# Altium schematic sheet 02_PWR_PMIC_RK806-1.SchDoc
size 594 x 420 mm; SheetNumber: 2; SheetTotal: 6
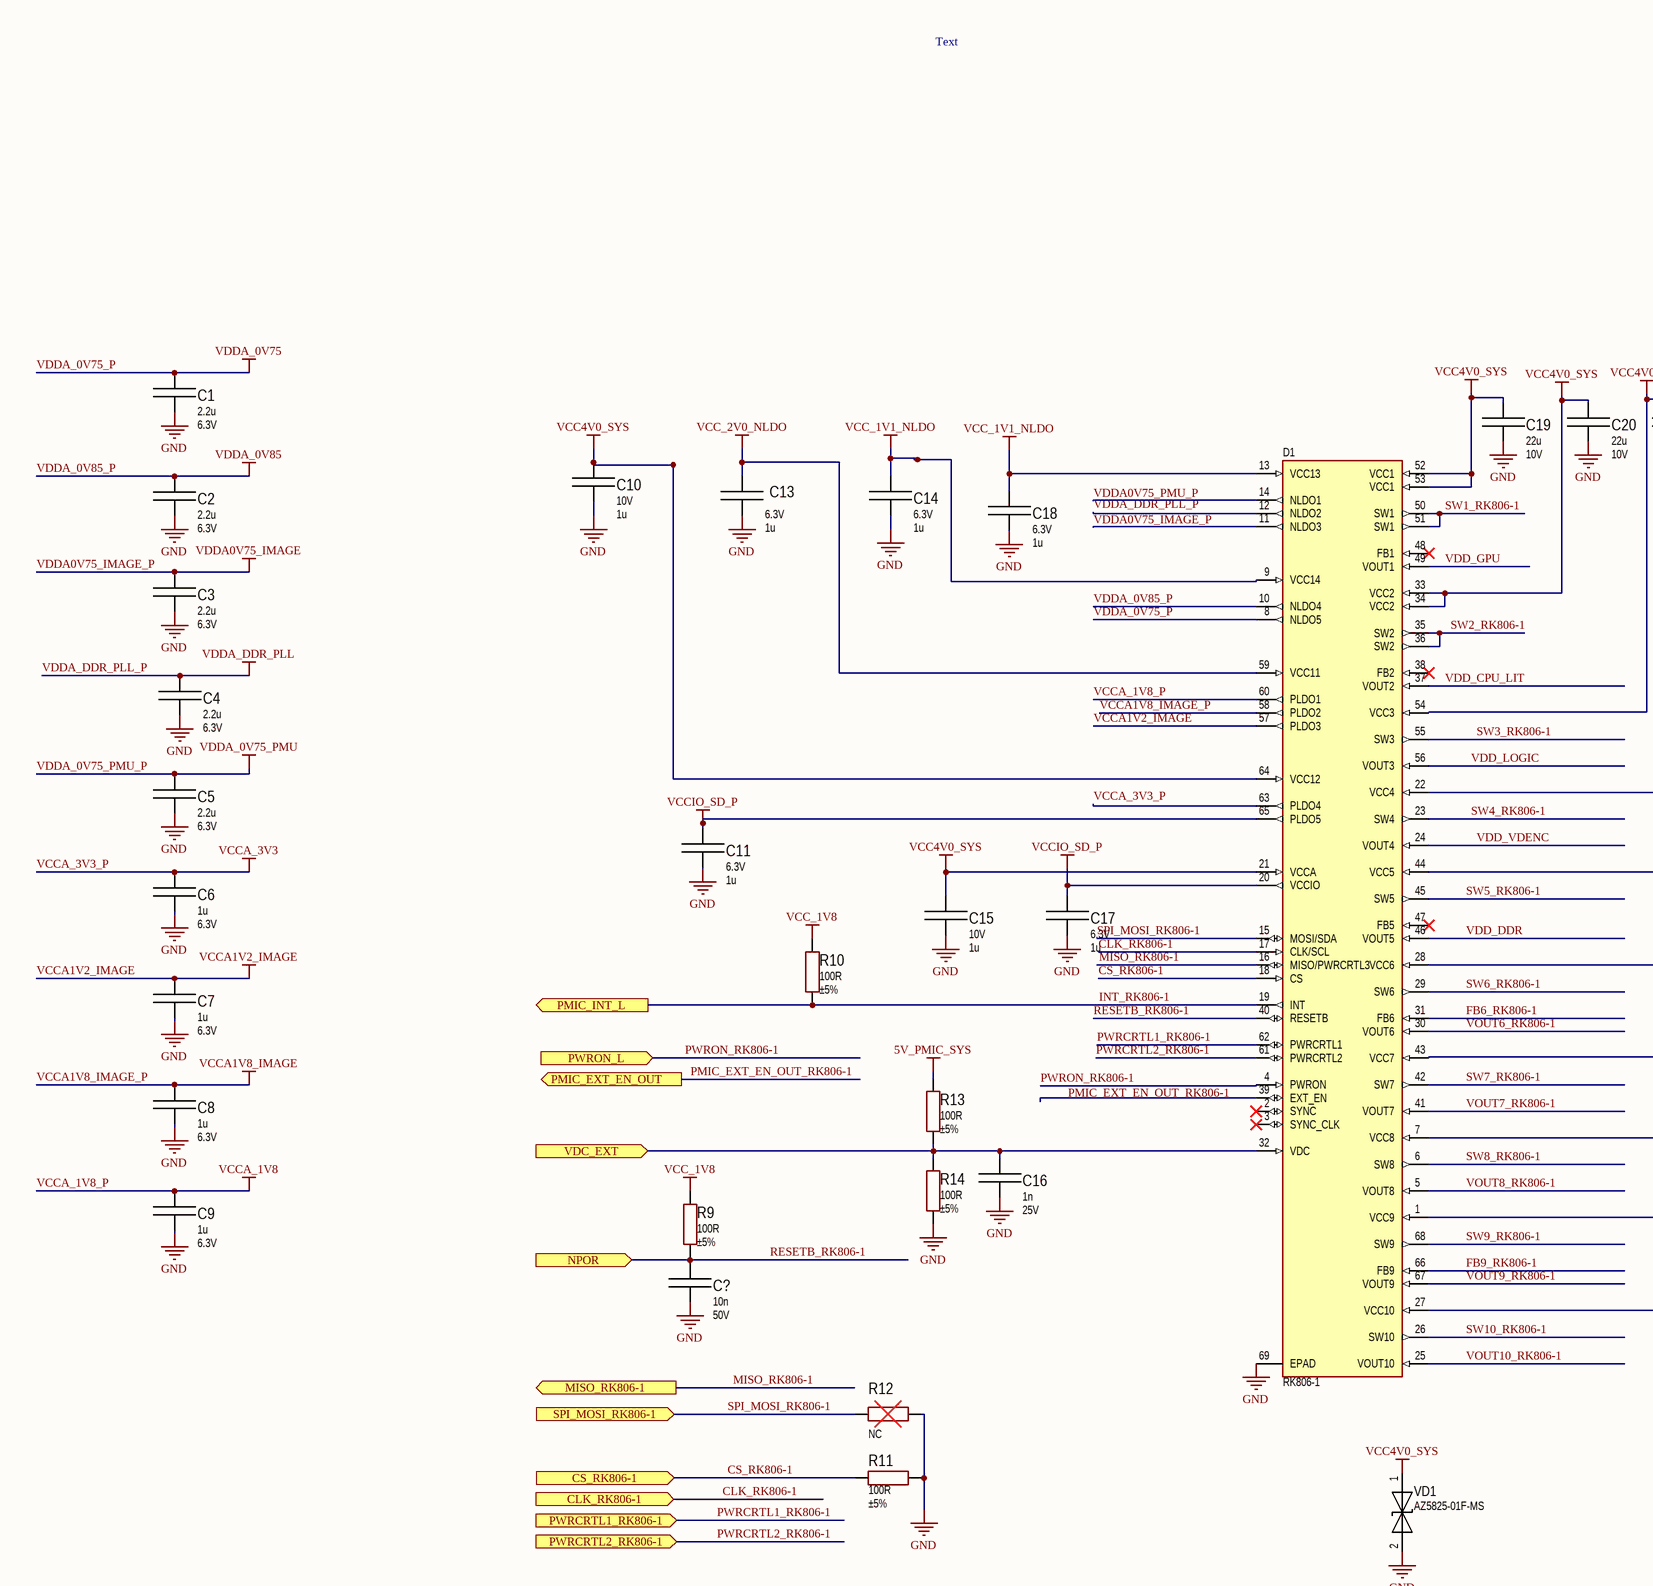
[diagram p0: 02_PWR_PMIC_RK806-1.SchDoc, top left]
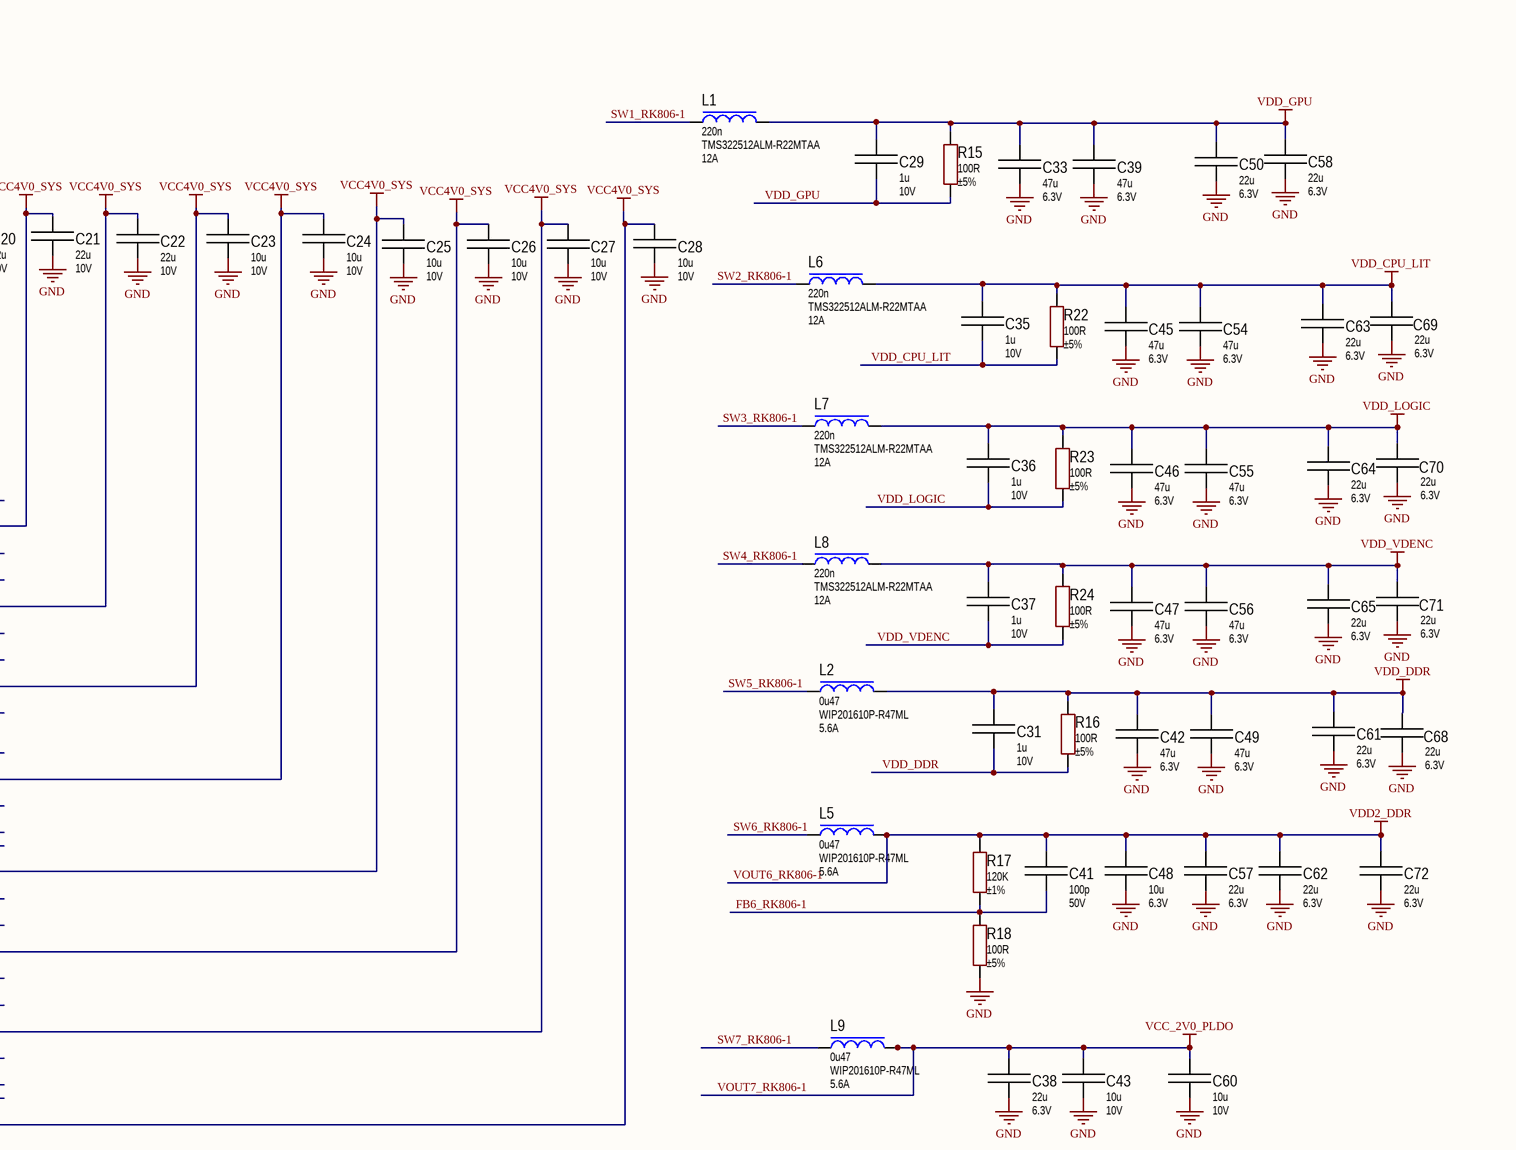
[diagram p1: 02_PWR_PMIC_RK806-1.SchDoc, top right]
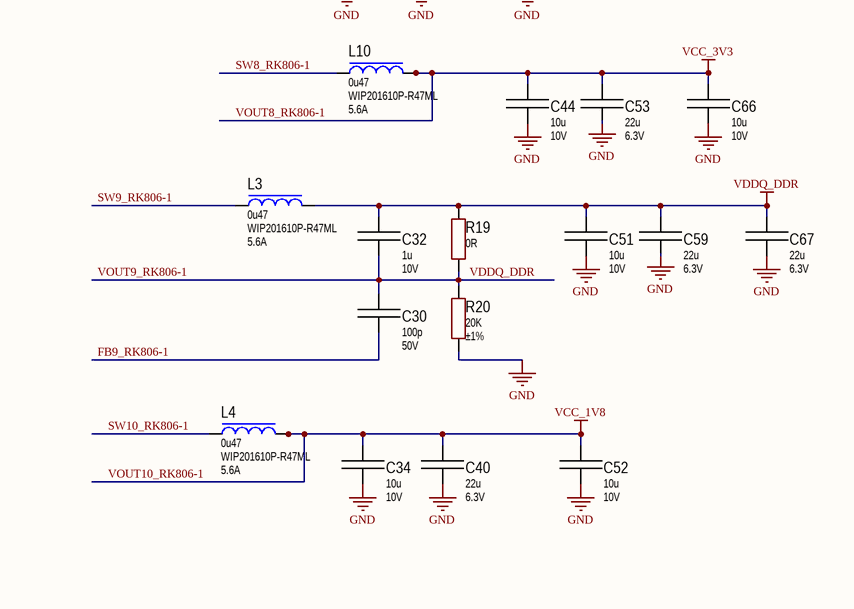
[diagram p2: 02_PWR_PMIC_RK806-1.SchDoc, bottom right]

## Parts
C1  value 2.2u  Voltage: 6.3V  [CAPC1005X06N]  (hidden comment: C1005X5R0J225K050BC)
C2  value 2.2u  Voltage: 6.3V  [CAPC1005X06N]  (hidden comment: C1005X5R0J225K050BC)
C3  value 2.2u  Voltage: 6.3V  [CAPC1005X06N]  (hidden comment: C1005X5R0J225K050BC)
C4  value 2.2u  Voltage: 6.3V  [CAPC1005X06N]  (hidden comment: C1005X5R0J225K050BC)
C5  value 2.2u  Voltage: 6.3V  [CAPC1005X06N]  (hidden comment: C1005X5R0J225K050BC)
C6  value 1u  Voltage: 6.3V  [CAPC1005X06N]  (hidden comment: C1005X5R0J105K050BB)
C7  value 1u  Voltage: 6.3V  [CAPC1005X06N]  (hidden comment: C1005X5R0J105K050BB)
C8  value 1u  Voltage: 6.3V  [CAPC1005X06N]  (hidden comment: C1005X5R0J105K050BB)
C9  value 1u  Voltage: 6.3V  [CAPC1005X06N]  (hidden comment: C1005X5R0J105K050BB)
C10  value 1u  Voltage: 10V  [CAPC1005X06N]  (hidden comment: C1005X5R1A105K050BB)
C11  value 1u  Voltage: 6.3V  [CAPC1005X06N]  (hidden comment: C1005X5R0J105K050BB)
C13  value 1u  Voltage: 6.3V  [CAPC1005X06N]  (hidden comment: C1005X5R0J105K050BB)
C14  value 1u  Voltage: 6.3V  [CAPC1005X06N]  (hidden comment: C1005X5R0J105K050BB)
C15  value 1u  Voltage: 10V  [CAPC1005X06N]  (hidden comment: C1005X5R1A105K050BB)
C16  value 1n  Voltage: 25V  [CAPC1005X06N]  (hidden comment: C1005C0G1E102J050BA)
C17  value 1u  Voltage: 6.3V  [CAPC1005X06N]  (hidden comment: C1005X5R0J105K050BB)
C18  value 1u  Voltage: 6.3V  [CAPC1005X06N]  (hidden comment: C1005X5R0J105K050BB)
C19  value 22u  Voltage: 10V  [CAPC2012X12N]  (hidden comment: C2012X5R1A226K125AB)
C20  value 22u  Voltage: 10V  [CAPC2012X12N]  (hidden comment: C2012X5R1A226K125AB)
C21  value 22u  Voltage: 10V  [CAPC2012X12N]  (hidden comment: C2012X5R1A226K125AB)
C22  value 22u  Voltage: 10V  [CAPC2012X12N]  (hidden comment: C2012X5R1A226K125AB)
C23  value 10u  Voltage: 10V  [CAPC1608X08N]  (hidden comment: C1608X5R1A106K080AC)
C24  value 10u  Voltage: 10V  [CAPC1608X08N]  (hidden comment: C1608X5R1A106K080AC)
C25  value 10u  Voltage: 10V  [CAPC1608X08N]  (hidden comment: C1608X5R1A106K080AC)
C26  value 10u  Voltage: 10V  [CAPC1608X08N]  (hidden comment: C1608X5R1A106K080AC)
C27  value 10u  Voltage: 10V  [CAPC1608X08N]  (hidden comment: C1608X5R1A106K080AC)
C28  value 10u  Voltage: 10V  [CAPC1608X08N]  (hidden comment: C1608X5R1A106K080AC)
C29  value 1u  Voltage: 10V  [CAPC1005X06N]  (hidden comment: C1005X5R1A105K050BB)
C30  value 100p  Voltage: 50V  [CAPC1005X06N]  (hidden comment: C1005C0G1H101K050BA)
C31  value 1u  Voltage: 10V  [CAPC1005X06N]  (hidden comment: C1005X5R1A105K050BB)
C32  value 1u  Voltage: 10V  [CAPC1005X06N]  (hidden comment: C1005X5R1A105K050BB)
C33  value 47u  Voltage: 6.3V  [CAPC2012X12N]  (hidden comment: C2012X5R0J476M125AC)
C34  value 10u  Voltage: 10V  [CAPC1608X08N]  (hidden comment: C1608X5R1A106K080AC)
C35  value 1u  Voltage: 10V  [CAPC1005X06N]  (hidden comment: C1005X5R1A105K050BB)
C36  value 1u  Voltage: 10V  [CAPC1005X06N]  (hidden comment: C1005X5R1A105K050BB)
C37  value 1u  Voltage: 10V  [CAPC1005X06N]  (hidden comment: C1005X5R1A105K050BB)
C38  value 22u  Voltage: 6.3V  [CAPC1608X08N]  (hidden comment: C1608X5R0J226M080AC)
C39  value 47u  Voltage: 6.3V  [CAPC2012X12N]  (hidden comment: C2012X5R0J476M125AC)
C40  value 22u  Voltage: 6.3V  [CAPC1608X08N]  (hidden comment: C1608X5R0J226M080AC)
C41  value 100p  Voltage: 50V  [CAPC1005X06N]  (hidden comment: C1005C0G1H101K050BA)
C42  value 47u  Voltage: 6.3V  [CAPC2012X12N]  (hidden comment: C2012X5R0J476M125AC)
C43  value 10u  Voltage: 10V  [CAPC1608X08N]  (hidden comment: C1608X5R1A106K080AC)
C44  value 10u  Voltage: 10V  [CAPC1608X08N]  (hidden comment: C1608X5R1A106K080AC)
C45  value 47u  Voltage: 6.3V  [CAPC2012X12N]  (hidden comment: C2012X5R0J476M125AC)
C46  value 47u  Voltage: 6.3V  [CAPC2012X12N]  (hidden comment: C2012X5R0J476M125AC)
C47  value 47u  Voltage: 6.3V  [CAPC2012X12N]  (hidden comment: C2012X5R0J476M125AC)
C48  value 10u  Voltage: 6.3V  [CAPC1608X08N]  (hidden comment: C1608X5R0J106K080AB)
C49  value 47u  Voltage: 6.3V  [CAPC2012X12N]  (hidden comment: C2012X5R0J476M125AC)
C50  value 22u  Voltage: 6.3V  [CAPC1608X08N]  (hidden comment: C1608X5R0J226M080AC)
C51  value 10u  Voltage: 10V  [CAPC1608X08N]  (hidden comment: C1608X5R1A106K080AC)
C52  value 10u  Voltage: 10V  [CAPC1608X08N]  (hidden comment: C1608X5R1A106K080AC)
C53  value 22u  Voltage: 6.3V  [CAPC1608X08N]  (hidden comment: C1608X5R0J226M080AC)
C54  value 47u  Voltage: 6.3V  [CAPC2012X12N]  (hidden comment: C2012X5R0J476M125AC)
C55  value 47u  Voltage: 6.3V  [CAPC2012X12N]  (hidden comment: C2012X5R0J476M125AC)
C56  value 47u  Voltage: 6.3V  [CAPC2012X12N]  (hidden comment: C2012X5R0J476M125AC)
C57  value 22u  Voltage: 6.3V  [CAPC1608X08N]  (hidden comment: C1608X5R0J226M080AC)
C58  value 22u  Voltage: 6.3V  [CAPC1608X08N]  (hidden comment: C1608X5R0J226M080AC)
C59  value 22u  Voltage: 6.3V  [CAPC1608X08N]  (hidden comment: C1608X5R0J226M080AC)
C60  value 10u  Voltage: 10V  [CAPC1608X08N]  (hidden comment: C1608X5R1A106K080AC)
C61  value 22u  Voltage: 6.3V  [CAPC1608X08N]  (hidden comment: C1608X5R0J226M080AC)
C62  value 22u  Voltage: 6.3V  [CAPC1608X08N]  (hidden comment: C1608X5R0J226M080AC)
C63  value 22u  Voltage: 6.3V  [CAPC1608X08N]  (hidden comment: C1608X5R0J226M080AC)
C64  value 22u  Voltage: 6.3V  [CAPC1608X08N]  (hidden comment: C1608X5R0J226M080AC)
C65  value 22u  Voltage: 6.3V  [CAPC1608X08N]  (hidden comment: C1608X5R0J226M080AC)
C66  value 10u  Voltage: 10V  [CAPC1608X08N]  (hidden comment: C1608X5R1A106K080AC)
C67  value 22u  Voltage: 6.3V  [CAPC1608X08N]  (hidden comment: C1608X5R0J226M080AC)
C68  value 22u  Voltage: 6.3V  [CAPC1608X08N]  (hidden comment: C1608X5R0J226M080AC)
C69  value 22u  Voltage: 6.3V  [CAPC1608X08N]  (hidden comment: C1608X5R0J226M080AC)
C70  value 22u  Voltage: 6.3V  [CAPC1608X08N]  (hidden comment: C1608X5R0J226M080AC)
C71  value 22u  Voltage: 6.3V  [CAPC1608X08N]  (hidden comment: C1608X5R0J226M080AC)
C72  value 22u  Voltage: 6.3V  [CAPC1608X08N]  (hidden comment: C1608X5R0J226M080AC)
C?  value 10n  Voltage: 50V  [CAPC1005X06N]  (hidden comment: GRM155R71H103KA88D)
D1  RK806-1  [QFN35P700X700X90_HS-69N]
L1  value 220n  MaxCurrent: 12A  [INDC3225X12N]  (hidden comment: TMS322512ALM-R22MTAA)
L2  value 0u47  MaxCurrent: 5.6A  [INDC2016X10N]  (hidden comment: WIP201610P-R47ML)
L3  value 0u47  MaxCurrent: 5.6A  [INDC2016X10N]  (hidden comment: WIP201610P-R47ML)
L4  value 0u47  MaxCurrent: 5.6A  [INDC2016X10N]  (hidden comment: WIP201610P-R47ML)
L5  value 0u47  MaxCurrent: 5.6A  [INDC2016X10N]  (hidden comment: WIP201610P-R47ML)
L6  value 220n  MaxCurrent: 12A  [INDC3225X12N]  (hidden comment: TMS322512ALM-R22MTAA)
L7  value 220n  MaxCurrent: 12A  [INDC3225X12N]  (hidden comment: TMS322512ALM-R22MTAA)
L8  value 220n  MaxCurrent: 12A  [INDC3225X12N]  (hidden comment: TMS322512ALM-R22MTAA)
L9  value 0u47  MaxCurrent: 5.6A  [INDC2016X10N]  (hidden comment: WIP201610P-R47ML)
L10  value 0u47  MaxCurrent: 5.6A  [INDC2016X10N]  (hidden comment: WIP201610P-R47ML)
R9  value 100R  Tolerance: ±5%  [RESC1005X04N]  (hidden comment: RC0402JR-07100RL)
R10  value 100R  Tolerance: ±5%  [RESC1005X04N]  (hidden comment: RC0402JR-07100RL)
R11  value 100R  Tolerance: ±5%  [RESC1005X04N]  (hidden comment: RC0402JR-07100RL)
R12  value NC  [RESC1005X04N]  (hidden comment: NC0402)  (no BOM)
R13  value 100R  Tolerance: ±5%  [RESC1005X04N]  (hidden comment: RC0402JR-07100RL)
R14  value 100R  Tolerance: ±5%  [RESC1005X04N]  (hidden comment: RC0402JR-07100RL)
R15  value 100R  Tolerance: ±5%  [RESC1005X04N]  (hidden comment: RC0402JR-07100RL)
R16  value 100R  Tolerance: ±5%  [RESC1005X04N]  (hidden comment: RC0402JR-07100RL)
R17  value 120K  Tolerance: ±1%  [RESC1005X04N]  (hidden comment: RC0402FR-07120KL)
R18  value 100R  Tolerance: ±5%  [RESC1005X04N]  (hidden comment: RC0402JR-07100RL)
R19  value 0R  [RESC1005X04N]  (hidden comment: RC0402JR-070RL)
R20  value 20K  Tolerance: ±1%  [RESC1005X04N]  (hidden comment: RC0402FR-0720KL)
R22  value 100R  Tolerance: ±5%  [RESC1005X04N]  (hidden comment: RC0402JR-07100RL)
R23  value 100R  Tolerance: ±5%  [RESC1005X04N]  (hidden comment: RC0402JR-07100RL)
R24  value 100R  Tolerance: ±5%  [RESC1005X04N]  (hidden comment: RC0402JR-07100RL)
VD1  AZ5825-01F-MS  [DIOC1006X04N]

## Ports
CLK_RK806-1 (in), CS_RK806-1 (in), MISO_RK806-1 (out), NPOR (in), PMIC_EXT_EN_OUT (out), PMIC_INT_L (out), PWRCRTL1_RK806-1 (in), PWRCRTL2_RK806-1 (in), PWRON_L (in), SPI_MOSI_RK806-1 (in), VDC_EXT (in)

## Nets
5V_PMIC_SYS: R13.2
GND: C1.1 C2.1 C3.1 C4.1 C5.1 C6.1 C7.1 C8.1 C9.1 C10.1 C11.1 C13.1 C14.1 C15.1 C16.1 C17.1 C18.1 C19.1 C20.1 C21.1 C22.1 C23.1 C24.1 C25.1 C26.1 C27.1 C28.1 C33.1 C34.1 C38.1 C39.1 C40.1 C42.1 C43.1 C44.1 C45.1 C46.1 C47.1 C48.1 C49.1 C50.1 C51.1 C52.1 C53.1 C54.1 C55.1 C56.1 C57.1 C58.1 C59.1 C60.1 C61.1 C62.1 C63.1 C64.1 C65.1 C66.1 C67.1 C68.1 C69.1 C70.1 C71.1 C72.1 C?.1 D1.69(EPAD) R11.1 R12.2 R14.1 R18.1 R20.1 VD1.2
VCC4V0_SYS: C10.2 C15.2 C19.2 C20.2 C21.2 C22.2 C23.2 C24.2 C25.2 C26.2 C27.2 C28.2 D1.1(VCC9) D1.7(VCC8) D1.21(VCCA) D1.22(VCC4) D1.27(VCC10) D1.28(VCC6) D1.33(VCC2) D1.34(VCC2) D1.43(VCC7) D1.44(VCC5) D1.52(VCC1) D1.53(VCC1) D1.64(VCC12) VD1.1
VCC_1V1_NLDO: C14.2 C18.2 D1.9(VCC14) D1.13(VCC13)
VCC_2V0_NLDO: C13.2 D1.59(VCC11)
VCCA1V2_IMAGE: C7.2 D1.57(PLDO3)
VCCA1V8_IMAGE_P: C8.2 D1.58(PLDO2)  [also labelled VCCA1V8_IMAGE]
VCCA_1V8_P: C9.2 D1.60(PLDO1)  [also labelled VCCA_1V8]
VCCA_3V3_P: C6.2 D1.63(PLDO4)  [also labelled VCCA_3V3]
VCCIO_SD_P: C11.2 C17.2 D1.20(VCCIO) D1.65(PLDO5)
VDD_CPU_LIT: C35.1 C35.2 C45.2 C54.2 C63.2 C69.2 D1.37(VOUT2) L6.2 R22.1 R22.2
VDD_DDR: C31.1 C31.2 C42.2 C49.2 C61.2 C68.2 D1.46(VOUT5) L2.2 R16.1 R16.2
VDD_GPU: C29.1 C29.2 C33.2 C39.2 C50.2 C58.2 D1.49(VOUT1) L1.2 R15.1 R15.2
VDD_LOGIC: C36.1 C36.2 C46.2 C55.2 C64.2 C70.2 D1.56(VOUT3) L7.2 R23.1 R23.2
VDD_VDENC: C37.1 C37.2 C47.2 C56.2 C65.2 C71.2 D1.24(VOUT4) L8.2 R24.1 R24.2
VDDA0V75_IMAGE_P: C3.2 D1.11(NLDO3)  [also labelled VDDA0V75_IMAGE]
VDDA_0V75_P: C1.2 D1.8(NLDO5)  [also labelled VDDA_0V75]
VDDA_0V75_PMU_P: C5.2  [also labelled VDDA_0V75_PMU]
VDDA_0V85_P: C2.2 D1.10(NLDO4)  [also labelled VDDA_0V85]
VDDA_DDR_PLL_P: C4.2 D1.12(NLDO2)  [also labelled VDDA_DDR_PLL]
VDDQ_DDR: C30.2 C32.1 C32.2 C51.2 C59.2 C67.2 D1.67(VOUT9) L3.2 R19.1 R19.2 R20.2  [also labelled VOUT9_RK806-1]
VOUT6_RK806-1: C41.2 C48.2 C57.2 C62.2 C72.2 D1.30(VOUT6) L5.2 R17.2  [also labelled VDD2_DDR]
VOUT7_RK806-1: C38.2 C43.2 C60.2 D1.41(VOUT7) L9.2  [also labelled VCC_2V0_PLDO]
VOUT8_RK806-1: C44.2 C53.2 C66.2 D1.5(VOUT8) L10.2  [also labelled VCC_3V3]
VOUT10_RK806-1: C34.2 C40.2 C52.2 D1.25(VOUT10) L4.2 R9.2 R10.2  [also labelled VCC_1V8]
CLK_RK806-1: D1.17(CLK/SCL) ; port CLK_RK806-1
CS_RK806-1: D1.18(CS) R11.2 ; port CS_RK806-1
FB6_RK806-1: C41.1 D1.31(FB6) R17.1 R18.2
FB9_RK806-1: C30.1 D1.66(FB9)
INT_RK806-1: D1.19(INT) R10.1 ; port PMIC_INT_L
MISO_RK806-1: D1.16(MISO/PWRCRTL3) ; port MISO_RK806-1
PMIC_EXT_EN_OUT_RK806-1: port PMIC_EXT_EN_OUT
PWRCRTL1_RK806-1: D1.62(PWRCRTL1) ; port PWRCRTL1_RK806-1
PWRCRTL2_RK806-1: D1.61(PWRCRTL2) ; port PWRCRTL2_RK806-1
PWRON_RK806-1: D1.4(PWRON) ; port PWRON_L
RESETB_RK806-1: C?.2 D1.40(RESETB) R9.1 ; port NPOR
SPI_MOSI_RK806-1: D1.15(MOSI/SDA) R12.1 ; port SPI_MOSI_RK806-1
SW1_RK806-1: D1.50(SW1) D1.51(SW1) L1.1
SW2_RK806-1: D1.35(SW2) D1.36(SW2) L6.1
SW3_RK806-1: D1.55(SW3) L7.1
SW4_RK806-1: D1.23(SW4) L8.1
SW5_RK806-1: D1.45(SW5) L2.1
SW6_RK806-1: D1.29(SW6) L5.1
SW7_RK806-1: D1.42(SW7) L9.1
SW8_RK806-1: D1.6(SW8) L10.1
SW9_RK806-1: D1.68(SW9) L3.1
SW10_RK806-1: D1.26(SW10) L4.1
VDC_EXT: C16.2 D1.32(VDC) R13.1 R14.2 ; port VDC_EXT
VDDA0V75_PMU_P: D1.14(NLDO1)

Not connected (* = marked no-connect by the designer): D1 2(SYNC)* 3(SYNC_CLK)* 38(FB2)* 39(EXT_EN) 47(FB5)* 48(FB1)* 54(VCC3)

## Notes on the sheet
- Text
- Labels drawn without touching a wire or pin: PMIC_EXT_EN_OUT_RK806-1
- DWG NO:
- REV:
- THIS DOCUMENT AND THE DATA DISCLOSED HEREIN OR
- HEREWITH IS THE PROPERTY OF ALTIUM LIMITED AND MAY
- BE FREELY DISTRIBUTED IN WHOLE. NO RIGHTS ARE
- RESERVED OR EXPRESS OR IMPLIED WARANTEE GIVEN.
- REVISION
- DESCRIPTION
- DATE
- APPROVED
- ENG:
- APPROVALS
- PROJECT
- DSN:
- CHK:
- REFERENCE DOCUMENTS
- PROJECT REVISION:
- TITLE
- DOCUMENT REVISION:
- DESIGN ITEM:
- BOM:
- FAB DWG:
- PCB DWG:
- ASSY DWG:
- SCALE:
- A2
- SIZE
- CAGE CODE
- FILE NAME
- DWG NO.
- SHEET
- OF
- REV

## Library data of the parts
C1-C5 = C1005X5R0J225K050BC: Ceramic capacitor, 2.2uF, X5R, ±10%, 6.3V, 0402, -55...+85°C; Manufacturer: TDK; Type: Ceramic SMD; PartNumber: C1005X5R0J225K050BC; Dielectric: X5R; Tolerance: ±10%; Temperature: -55...+85°C; Package: 0402; ComponentLink1Description: Link; ComponentLink1URL: https://product.tdk.com/en/system/files/dam/doc/product/capacitor/ceramic/mlcc/catalog/mlcc_commercial_general_en.pdf; ComponentLink2Description: LocalLink; ComponentLink2URL: C:\Users\Public\Documents\Altium\datasheet\Capacitors\mlcc_commercial_general_en.pdf
C6-C9 C11 C13 C14 C17 C18 = C1005X5R0J105K050BB: Ceramic capacitor, 1uF, X5R, ±10%, 6.3V, 0402, -55...+85°C; Manufacturer: TDK; Type: Ceramic SMD; PartNumber: C1005X5R0J105K050BB; Dielectric: X5R; Tolerance: ±10%; Temperature: -55...+85°C; Package: 0402; ComponentLink1Description: Link; ComponentLink1URL: https://product.tdk.com/en/system/files/dam/doc/product/capacitor/ceramic/mlcc/catalog/mlcc_commercial_general_en.pdf; ComponentLink2Description: LocalLink; ComponentLink2URL: C:\Users\Public\Documents\Altium\datasheet\Capacitors\mlcc_commercial_general_en.pdf
C10 C15 C29 C31 C32 C35-C37 = C1005X5R1A105K050BB: Ceramic capacitor, 1uF, X5R, ±10%, 10V, 0402, -55...+85°C; Manufacturer: TDK; Type: Ceramic SMD; PartNumber: C1005X5R1A105K050BB; Dielectric: X5R; Tolerance: ±10%; Temperature: -55...+85°C; Package: 0402; ComponentLink1Description: Link; ComponentLink1URL: https://product.tdk.com/en/system/files/dam/doc/product/capacitor/ceramic/mlcc/catalog/mlcc_commercial_general_en.pdf; ComponentLink2Description: LocalLink; ComponentLink2URL: C:\Users\Public\Documents\Altium\datasheet\Capacitors\mlcc_commercial_general_en.pdf
C16 = C1005C0G1E102J050BA: Ceramic capacitor, 1nF, C0G, ±5%, 25V, 0402, -55...+125°C; Manufacturer: TDK; Type: Ceramic SMD; PartNumber: C1005C0G1E102J050BA; Dielectric: C0G; Tolerance: ±5%; Temperature: -55...+125°C; Package: 0402; ComponentLink1Description: Link; ComponentLink1URL: https://product.tdk.com/en/system/files/dam/doc/product/capacitor/ceramic/mlcc/catalog/mlcc_commercial_general_en.pdf; ComponentLink2Description: LocalLink; ComponentLink2URL: C:\Users\Public\Documents\Altium\datasheet\Capacitors\mlcc_commercial_general_en.pdf
C19-C22 = C2012X5R1A226K125AB: Ceramic capacitor, 22uF, X5R, ±10%, 10V, 0805, -55...+85°; Manufacturer: TDK; Type: Ceramic SMD; PartNumber: C2012X5R1A226K125AB; Dielectric: X5R; Tolerance: ±10%; Temperature: -55...+85°C; Package: 0805; ComponentLink1Description: Link; ComponentLink1URL: https://product.tdk.com/system/files/dam/doc/product/capacitor/ceramic/mlcc/catalog/mlcc_commercial_general_en.pdf; ComponentLink2Description: LocalLink; ComponentLink2URL: C:\Users\Public\Documents\Altium\datasheet\Capacitors\mlcc_commercial_general_en.pdf
C23-C28 C34 C43 C44 C51 C52 C60 C66 = C1608X5R1A106K080AC: Ceramic capacitor, 10uF, X5R, ±10%, 10V, 0603, -55...+85°C; Manufacturer: TDK; Type: Ceramic SMD; PartNumber: C1608X5R1A106K080AC; Dielectric: X5R; Tolerance: ±10%; Temperature: -55...+85°C; Package: 0603; ComponentLink1Description: Link; ComponentLink1URL: https://product.tdk.com/system/files/dam/doc/product/capacitor/ceramic/mlcc/catalog/mlcc_commercial_general_en.pdf; ComponentLink2Description: LocalLink; ComponentLink2URL: C:\Users\Public\Documents\Altium\datasheet\Capacitors\mlcc_commercial_general_en.pdf
C30 C41 = C1005C0G1H101K050BA: Ceramic capacitor, 100pF, C0G, ±10%, 50V, 0402, -55...+125°C; Manufacturer: TDK; Type: Ceramic SMD; PartNumber: C1005C0G1H101K050BA; Dielectric: C0G; Tolerance: ±10%; Temperature: -55...+125°C; Package: 0402; ComponentLink1Description: Link; ComponentLink1URL: https://product.tdk.com/en/system/files/dam/doc/product/capacitor/ceramic/mlcc/catalog/mlcc_commercial_general_en.pdf; ComponentLink2Description: LocalLink; ComponentLink2URL: C:\Users\Public\Documents\Altium\datasheet\Capacitors\mlcc_commercial_general_en.pdf
C33 C39 C42 C45-C47 C49 C54-C56 = C2012X5R0J476M125AC: Ceramic capacitor, 47uF, X5R, ±20%, 6.3V, 0805, -55...+85°; Manufacturer: TDK; Type: Ceramic SMD; PartNumber: C2012X5R0J476M125AC; Dielectric: X5R; Tolerance: ±20%; Temperature: -55...+85°C; Package: 0805; ComponentLink1Description: Link; ComponentLink1URL: https://product.tdk.com/system/files/dam/doc/product/capacitor/ceramic/mlcc/catalog/mlcc_commercial_general_en.pdf; ComponentLink2Description: LocalLink; ComponentLink2URL: C:\Users\Public\Documents\Altium\datasheet\Capacitors\mlcc_commercial_general_en.pdf
C38 C40 C50 C53 C57-C59 C61-C65 C67-C72 = C1608X5R0J226M080AC: Ceramic capacitor, 22uF, X5R, ±20%, 6.3V, 0603, -55...+85°C; Manufacturer: TDK; Type: Ceramic SMD; PartNumber: C1608X5R0J226M080AC; Dielectric: X5R; Tolerance: ±20%; Temperature: -55...+85°C; Package: 0603; ComponentLink1Description: Link; ComponentLink1URL: https://product.tdk.com/system/files/dam/doc/product/capacitor/ceramic/mlcc/catalog/mlcc_commercial_general_en.pdf; ComponentLink2Description: LocalLink; ComponentLink2URL: C:\Users\Public\Documents\Altium\datasheet\Capacitors\mlcc_commercial_general_en.pdf
C48 = C1608X5R0J106K080AB: Ceramic capacitor, 10uF, X5R, ±10%, 6.3V, 0603, -55...+85°C; Manufacturer: TDK; Type: Ceramic SMD; PartNumber: C1608X5R0J106K080AB; Dielectric: X5R; Tolerance: ±10%; Temperature: -55...+85°C; Package: 0603; ComponentLink1Description: Link; ComponentLink1URL: https://product.tdk.com/system/files/dam/doc/product/capacitor/ceramic/mlcc/catalog/mlcc_commercial_general_en.pdf; ComponentLink2Description: LocalLink; ComponentLink2URL: C:\Users\Public\Documents\Altium\datasheet\Capacitors\mlcc_commercial_general_en.pdf
C? = GRM155R71H103KA88D: Ceramic capacitor, 10nF, X7R, ±10%, 50V, 0402, -55...+125°C; Manufacturer: Murata; Type: Ceramic SMD; PartNumber: GRM155R71H103KA88D; Dielectric: X7R; Tolerance: ±10%; Temperature: -55...+125°C; Package: 0402; ComponentLink1Description: Link; ComponentLink1URL: https://www.murata.com/products/productdetail?partno=GRM155R71H103KA88%23; ComponentLink2Description: LocalLink; ComponentLink2URL: C:\Users\Public\Documents\Altium\Datasheet\Capacitors\GRM155R71H103KA88#.pdf
D1 = RK806-1: Complex power-management integrated circuit (PMIC); Manufacturer: RockChip; Type: PMIC; Package: QFN68; Temperature: -40...+125°C; ComponentLink1Description: LocalLink; ComponentLink1URL: C:\Users\Public\Documents\Altium\Datasheet\ICs_PWR\RK806-1.pdf; PartNumber: RK806-1
L1 L6-L8 = TMS322512ALM-R22MTAA: Power Inductor, 220nH, ±20%, 12A, SMD 3225, -40...+125°C; Manufacturer: INPAQ; DCR: 0.006R; Type: Power Inductor; Tolerance: ±20%; Temperature: -40...+125°C; Package: SMD 3225; ComponentLink1Description: Link; ComponentLink1URL: https://product.tdk.com/system/files/dam/doc/product/inductor/inductor/smd/catalog/inductor_commercial_power_tms322512alm_en.pdf; ComponentLink2Description: LocalLink; ComponentLink2URL: C:\Users\Public\Documents\Altium\Datasheet\Inductance\inductor_commercial_power_tms322512alm_en.pdf; PartNumber: TMS322512ALM-R22MTAA
L2-L5 L9 L10 = WIP201610P-R47ML: Power Inductor, 0.47uH, ±20%, 5.6A, SMD 2016, -40...+125°C; Manufacturer: INPAQ; DCR: 0.033R; Type: Power Inductor; Tolerance: ±20%; Temperature: -40...+125°C; Package: SMD 2016; ComponentLink1Description: Link; ComponentLink1URL: https://www.inpaqgp.com/product-co1.php?k=hZx4bT6%2FQ%2BNwEKUtRT9BJg%3D%3D#; ComponentLink2Description: LocalLink; ComponentLink2URL: C:\Users\Public\Documents\Altium\Datasheet\Inductance\spec_WIP201610.pdf; PartNumber: WIP201610P-R47ML
R9-R11 R13-R16 R18 R22-R24 = RC0402JR-07100RL: Resistor film, 100R, ±5%, 0402, 0.0625W, -55...+155°C; Manufacturer: Yageo; PartNumber: RC0402JR-07100RL; Type: Resistor film; Power: 0.0625W; ComponentLink1Description: Link; ComponentLink1URL: https://www.yageo.com/upload/media/product/productsearch/datasheet/rchip/PYu-RC_Group_51_RoHS_L_12.pdf; Temperature: -55...+155°C; Package: 0402; ComponentLink2Description: LocalLink; ComponentLink2URL: C:\Users\Public\Documents\Altium\Datasheet\Resistors\PYu-RC_Group_51_RoHS_L_12.pdf
R12 = NC0402: NC, No BOM; PartNumber: NC; Type: Resistor film; Package: 0402
R17 = RC0402FR-07120KL: Resistor film, 120K, ±1%, 0402, 0.0625W, -55...+155°C; Manufacturer: Yageo; PartNumber: RC0402FR-07120KL; Type: Resistor film; Power: 0.0625W; ComponentLink1Description: Link; ComponentLink1URL: https://www.yageo.com/upload/media/product/productsearch/datasheet/rchip/PYu-RC_Group_51_RoHS_L_12.pdf; Temperature: -55...+155°C; Package: 0402; ComponentLink2Description: LocalLink; ComponentLink2URL: C:\Users\Public\Documents\Altium\Datasheet\Resistors\PYu-RC_Group_51_RoHS_L_12.pdf
R19 = RC0402JR-070RL: Resistor film, 0R, 0402, -55...+155°C; Manufacturer: Yageo; PartNumber: RC0402JR-070RL; Type: Resistor film; ComponentLink1Description: Link; ComponentLink1URL: https://www.yageo.com/upload/media/product/productsearch/datasheet/rchip/PYu-RC_Group_51_RoHS_L_12.pdf; Temperature: -55...+155°C; Package: 0402; ComponentLink2Description: LocalLink; ComponentLink2URL: C:\Users\Public\Documents\Altium\Datasheet\Resistors\PYu-RC_Group_51_RoHS_L_12.pdf
R20 = RC0402FR-0720KL: Resistor film, 20K, ±1%, 0402, 0.0625W, -55...+155°C; Manufacturer: Yageo; PartNumber: RC0402FR-0720KL; Type: Resistor film; Power: 0.0625W; ComponentLink1Description: Link; ComponentLink1URL: https://www.yageo.com/upload/media/product/productsearch/datasheet/rchip/PYu-RC_Group_51_RoHS_L_12.pdf; Temperature: -55...+155°C; Package: 0402; ComponentLink2Description: LocalLink; ComponentLink2URL: C:\Users\Public\Documents\Altium\Datasheet\Resistors\PYu-RC_Group_51_RoHS_L_12.pdf
VD1 = AZ5825-01F-MS: ESD per IEC 61000-4-2; Manufacturer: MSKSEMI; ComponentLink1Description: Link; ComponentLink1URL: https://www.lcsc.com/datasheet/lcsc_datasheet_2306211604_MSKSEMI-AZ5825-01F-MS_C7379989.pdf; ComponentLink2Description: LocalLink; ComponentLink2URL: C:\Users\Public\Documents\Altium\Datasheet\Diodes\2306211604_MSKSEMI-AZ5825-01F-MS_C7379989.pdf; Type: ESD; Temperature: -65...+150°C; Package: DFN1006-2L; PartNumber: AZ5825-01F-MS